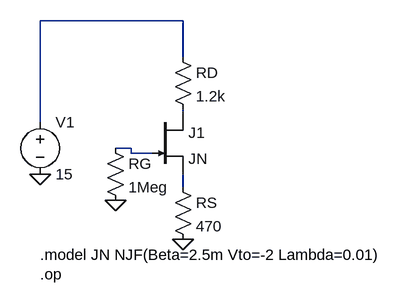
[diagram p0: schematic Ex04.asc]
Ex04.asc, the LTspice schematic file:
Version 4
SHEET 1 880 680
WIRE 100 216 100 60
WIRE 100 60 320 60
WIRE 320 60 320 116
WIRE 320 196 320 200
WIRE 320 296 320 316
WIRE 216 256 240 256
WIRE 240 256 240 264
WIRE 240 264 272 264
FLAG 100 296 0
FLAG 216 336 0
FLAG 320 396 0
SYMBOL voltage 100 200 R0
SYMATTR InstName V1
SYMATTR Value 15
SYMBOL res 200 240 R0
SYMATTR InstName RG
SYMATTR Value 1Meg
SYMBOL res 304 100 R0
SYMATTR InstName RD
SYMATTR Value 1.2k
SYMBOL njf 272 200 R0
SYMATTR InstName J1
SYMATTR Value JN
SYMBOL res 304 300 R0
SYMATTR InstName RS
SYMATTR Value 470
TEXT 100 420 Left 2 !.model JN NJF(Beta=2.5m Vto=-2 Lambda=0.01)
TEXT 100 450 Left 2 !.op

The netlist it stands for:
* Ex04.asc
V1 N001 0 15
RG N004 0 1Meg
RD N001 N002 1.2k
J1 N002 N004 N003 JN
RS N003 0 470
.model NJF NJF
.model PJF PJF
.lib standard.jft
.model JN NJF(Beta=2.5m Vto=-2 Lambda=0.01)
.op
.backanno
.end